# Altium schematic sheet Power.SchDoc
size A; SheetNumber: 3; SheetTotal: 3
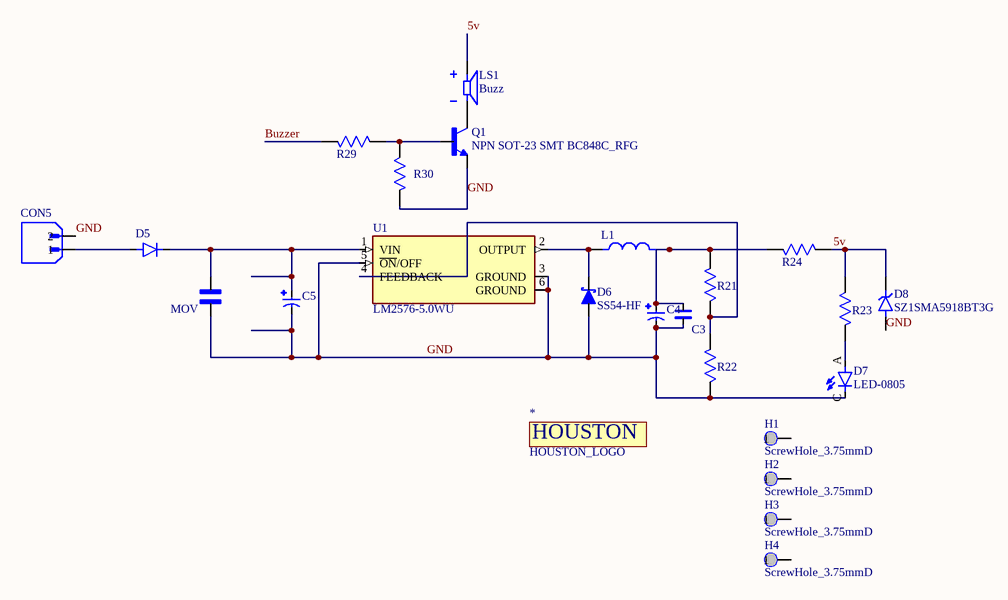
[diagram p0: Power.SchDoc]

## Parts
*  HOUSTON_LOGO  [HOUSTON_LOGO]
C3  CAP 0.1uF 50V 0805  [CAP CER 0.1uF/50V 5%]  (value not drawn)
C4  CAP ELE 10µF 25V TH  [CAP ELE 10µF 25V TH]  (value not drawn)
C5  CAP ELE 10µF 25V TH  [CAP ELE 10µF 25V TH]  (value not drawn)
CON5  2 Pin Terminal Block 5MM RA  [2 Pin Terminal Block 5MM RA]  (value not drawn)
D5  DIODE M7 DO-214AC  [DIODE M7 DO-214AC]  (value not drawn)
D6  SS54-HF  [DIOM5025X220N]
D7  LED-0805  [LED-0805]
D8  SZ1SMA5918BT3G  [DIOM5226X220N]
H1  ScrewHole_3.75mmD  [ScrewHole_3.75mmD - duplicate]
H2  ScrewHole_3.75mmD  [ScrewHole_3.75mmD - duplicate]
H3  ScrewHole_3.75mmD  [ScrewHole_3.75mmD - duplicate]
H4  ScrewHole_3.75mmD  [ScrewHole_3.75mmD - duplicate]
L1  INDUCTOR 8040S SWPA8040S120MT  [INDUCTOR 8040S SWPA8040S120MT]  (value not drawn)
LS1  Buzz  [CUI_CMI-1614-1285T]
MOV  Ceramic capacitor 3300pF4KV  [Ceramic capacitor 3300pF4KV]  (value not drawn)
Q1  NPN SOT-23 SMT BC848C_RFG  [NPN SOT-23 SMT BC848C_RFG]
R21  RES 3K 0.25W 5% 0805  [RES 0805 10K/0.25W 5%]  (value not drawn)
R22  RES 1K 0.25W 5% 0805  [RES 0805 10K/0.25W 5%]  (value not drawn)
R23  RES 330 E 0.25W 5% 0805  [RES 0805 10K/0.25W 5%]  (value not drawn)
R24  RES 3K 0.25W 5% 0805  [RES 0805 10K/0.25W 5%]  (value not drawn)
R29  RES 1K 0.25W 5% 0805  [RES 0805 10K/0.25W 5%]  (value not drawn)
R30  RES 10K 0.25W 5% 0805  [RES 0805 10K/0.25W 5%]  (value not drawn)
U1  LM2576-5.0WU  [DPAK6P170_1524X459L254X81N]

## Nets
5v: D8.C LS1.P R23.1 R24.1
Buzzer: R29.2
GND: C3.1 C4.N C5.N CON5.2 D6.2(A) D7.C D8.A MOV.1 Q1.2(E) R22.1 R30.2 U1.3(GROUND) U1.5(~{ON}/OFF) U1.6(GROUND)
NetC3_2: C3.2 C4.P L1.2 R21.2 R24.2
NetC5_P: C5.P D5.C(K) MOV.2 U1.1(VIN)
NetCON5_1: CON5.1 D5.A
NetD6_1: D6.1(K) L1.1 U1.2(OUTPUT)
NetD7_A: D7.A R23.2
NetLS1_N: LS1.N Q1.3(C)
NetQ1_1: Q1.1(B) R29.1 R30.1
NetR21_1: R21.1 R22.2 U1.4(FEEDBACK)

Not connected (* = marked no-connect by the designer): H1 1; H2 1; H3 1; H4 1

## Notes on the sheet
- (in symbol HOUSTON_LOGO) HOUSTON

## Library data of the parts
C3 = CAP CER 0.1uF/50V 5%: CAP CER 0.1uF/50V  Ceramic Capacitor X7R 0805 (2012 Metric) SMT; MF: Samsung; MP: CL21B104KCFNNNE; Purchase-URL: https://pricing.snapeda.com/search?q=CL21B104KCFNNNE&ref=eda; Package: 0805 Samsung; Check_prices: https://www.snapeda.com/parts/CL21B104KCFNNNE/Samsung+Electro-Mechanics/view-part/?ref=eda; Value: *; SnapEDA_Link: https://www.snapeda.com/parts/CL21B104KCFNNNE/Samsung+Electro-Mechanics/view-part/?ref=snap; Digi-Key_Part_Number: 1276-6840-2-ND
C4 C5 = CAP ELE 10µF 25V TH_1: 10µF 25V Aluminum Electrolytic Capacitors Radial Lead Type THT, Dia-5mm, Pitch-2mm ECEA1EN100UI; MF: Panasonic; Package: RADIAL-2 Panasonic; Purchase-URL: https://pricing.snapeda.com/search/part/ECEA1EN100UI/?ref=eda; Value: *; Digi-Key_Part_Number: ECE-A1EN100UI-ND; SnapEDA_Link: https://www.snapeda.com/parts/ECEA1EN100UI/Panasonic/view-part/5788532/?ref=snap; MP: ECEA1EN100UI; Check_prices: https://www.snapeda.com/parts/ECEA1EN100UI/Panasonic/view-part/5788532/?ref=eda
CON5 = 2 Pin Terminal Block 5MM RA: 2 Pin Terminal Block HDR 5MM THT RA _OQ0271510000G; MF: Amphenol Anytek; SnapEDA_Link: https://www.snapeda.com/parts/OQ0271510000G/Amphenol/view-part/?ref=snap; Package: None; Value: *; MP: OQ0271510000G; Check_prices: https://www.snapeda.com/parts/OQ0271510000G/Amphenol/view-part/?ref=eda
D5 = DIODE M7 DO-214AC: M7 General Purpose SMD Rectifier Diode SMA (DO-214AC) 1A 1000V 1n4007 RS2MA; MF: Taiwan Semiconductor; SnapEDA_Link: https://www.snapeda.com/parts/RS2MA/Taiwan+Semiconductor/view-part/?ref=snap; Package: DO-214AC-2 Taiwan Semiconductor; Value: *; MP: RS2MA; Check_prices: https://www.snapeda.com/parts/RS2MA/Taiwan+Semiconductor/view-part/?ref=eda
D6 = SS54-HF: Diode Schottky 40 V 5A Surface Mount DO-214AC (SMA); MF: Comchip Technology; SnapEDA_Link: https://www.snapeda.com/parts/SS54-HF/Comchip/view-part/?ref=snap; Package: DO-214AC-214 Comchip Technology; Value: *; MP: SS54-HF; Check_prices: https://www.snapeda.com/parts/SS54-HF/Comchip/view-part/?ref=eda
D7 = LED-0805: Red 640nm LED Indication - Discrete 1.85V 0805 (2012 Metric) SMT APT2012SRCPRV; MF: Kingbright; SnapEDA_Link: https://www.snapeda.com/parts/APT2012SRCPRV/Kingbright/view-part/?ref=snap; Package: 0805 Kingbright; Value: *; MP: APT2012SRCPRV; Check_prices: https://www.snapeda.com/parts/APT2012SRCPRV/Kingbright/view-part/?ref=eda
D8 = SZ1SMA5918BT3G: Zener Diode 5.1 V 1.5 W Â±5% Surface Mount SMA; MF: ON Semiconductor; SnapEDA_Link: https://www.snapeda.com/parts/SZ1SMA5918BT3G/Onsemi/view-part/?ref=snap; Package: SMA-2 ON Semiconductor; Value: *; MP: SZ1SMA5918BT3G; Check_prices: https://www.snapeda.com/parts/SZ1SMA5918BT3G/Onsemi/view-part/?ref=eda
H1-H4 = ScrewHole_3.75mmD: SCREW HEAD DIA 4.5MM, SREW LEG DIA 3 MM
L1 = INDUCTOR 8040S SWPA8040S120MT: SWPA8040S120MT SMD 8.0×8.0x4.0mm 8040S 12uH Â±20% 2.8A 142 mOhm SMT Shielded Wirewound Inductor; MF: Abracon LLC; MP: ASPI-8040S-510M-T; Purchase-URL: https://pricing.snapeda.com/search/part/ASPI-8040S-510M-T/?ref=eda; Value: *; SnapEDA_Link: https://www.snapeda.com/parts/ASPI-8040S-510M-T/Abracon+LLC/view-part/?ref=snap; Package: Nonstandard Abracon LLC; Check_prices: https://www.snapeda.com/parts/ASPI-8040S-510M-T/Abracon+LLC/view-part/?ref=eda; Availability: In Stock; Price: None
LS1 = CMI-1614-1285T: 16 mm, 12 Vdc, 85 dB, Through Hole, Driving Circuit, Magnetic Audio Indicator Buzzer; MF: Same Sky; SnapEDA_Link: https://www.snapeda.com/parts/CMI-1614-1285T/Same+Sky/view-part/?ref=snap; Package: CUI Inc.; Value: *; MP: CMI-1614-1285T; Check_prices: https://www.snapeda.com/parts/CMI-1614-1285T/Same+Sky/view-part/?ref=eda
MOV = Ceramic capacitor 3300pF4KV: Ceramic capacitor 3300pF4KV, Tension nominale 400Vac(r.m.s.), 4KV ESD, DE2E3SA332MA3BY02F; MF: Murata; Package: NONSTANDARD; Value: *; Purchase-URL: https://pricing.snapeda.com/search/part/DE2E3SA332MA3BY02F/?ref=eda; Availability: Bad; SnapEDA_Link: https://www.snapeda.com/parts/DE2E3SA332MA3BY02F/Murata/view-part/2799752/?ref=snap; Price: None; MP: DE2E3SA332MA3BY02F; Check_prices: https://www.snapeda.com/parts/DE2E3SA332MA3BY02F/Murata/view-part/2799752/?ref=eda
Q1 = NPN SOT-23 SMT BC848C_RFG: NPN SMT BC848C_RFG SOT-23, 30V, 0.1A, NPN Transistor; MF: Taiwan Semiconductor; MP: BC848C RFG; SnapEDA_Link: https://www.snapeda.com/parts/BC848C%20RFG/Taiwan+Semiconductor/view-part/?ref=snap; Package: SOT-23 Taiwan Semiconductor; Value: *; Check_prices: https://www.snapeda.com/parts/BC848C%20RFG/Taiwan+Semiconductor/view-part/?ref=eda
R21-R24 R29 R30 = RES 10K 0.25W 5% 0805: RESISTOR, THICK FILM, 10K, 5%, 0805 0.25W SMT; MP: ERJ-6GEYJ103V; MF: Panasonic Electronic; Price: None; Check_prices: https://www.snapeda.com/parts/ERJ-6GEYJ103V/Panasonic+Electronic+Components/view-part/?ref=eda; Package: 805-2 Panasonic; Purchase-URL: https://pricing.snapeda.com/search/part/ERJ-6GEYJ103V/?ref=eda; Availability: In Stock; SnapEDA_Link: https://www.snapeda.com/parts/ERJ-6GEYJ103V/Panasonic+Electronic+Components/view-part/?ref=snap; Value: *
U1 = LM2576-5.0WU: Buck Switching Regulator IC Positive Fixed 5V 1 Output 3A TO-263-6, D2PAK (5 Leads + Tab), TO-263BA; MF: Microchip; SnapEDA_Link: https://www.snapeda.com/parts/LM2576-5.0WU/Microchip/view-part/?ref=snap; Package: TO-263-5 Micrel; Value: *; MP: LM2576-5.0WU; Check_prices: https://www.snapeda.com/parts/LM2576-5.0WU/Microchip/view-part/?ref=eda